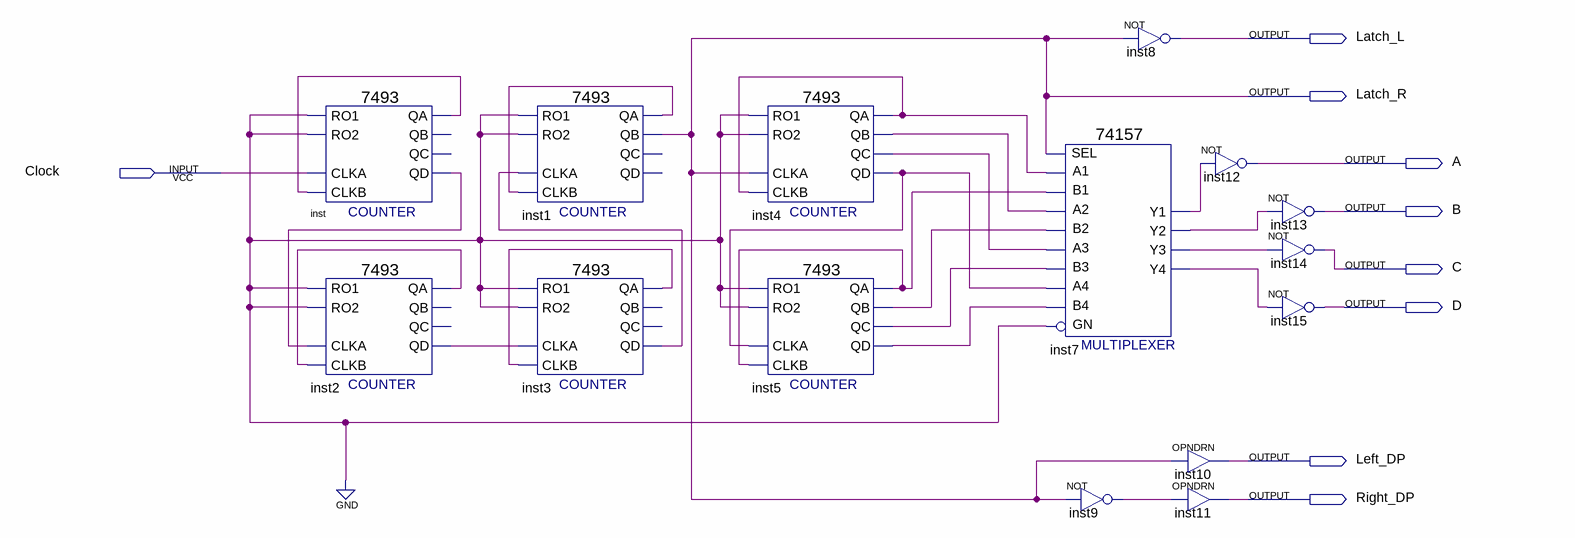
[diagram p0: schematic sheet]
// Quartus schematic test3.bdf as structural Verilog: 15 symbols, 9 pins
module test3 (
  input  Clock,
  output Latch_L,
  output Latch_R,
  output A,
  output B,
  output C,
  output D,
  output Left_DP,
  output Right_DP
);

  wire inst1_qa, inst2_qa, inst2_qd, inst3_qa, inst3_qd, inst4_qa, inst4_qb, inst4_qc, inst4_qd, inst5_qa,
       inst5_qb, inst5_qc, inst5_qd, inst7_y1, inst7_y2, inst7_y3, inst7_y4, inst9_out, inst_qa, inst_qd;

  \7493  inst (.RO1(1'b0), .RO2(1'b0), .CLKA(Clock), .CLKB(inst_qa), .QA(inst_qa), .QD(inst_qd));  // open: QC, QB
  \7493  inst2 (.RO1(1'b0), .RO2(1'b0), .CLKA(inst_qd), .CLKB(inst2_qa), .QA(inst2_qa), .QD(inst2_qd));  // open: QC, QB
  \7493  inst1 (.RO1(1'b0), .RO2(1'b0), .CLKA(inst3_qd), .CLKB(inst1_qa), .QB(Latch_R), .QA(inst1_qa));  // open: QC, QD
  \7493  inst3 (
    .RO1(1'b0), .RO2(1'b0), .CLKA(inst2_qd), .CLKB(inst3_qa), .QA(inst3_qa), .QD(inst3_qd));  // open: QC, QB
  \7493  inst4 (
    .RO1(1'b0), .RO2(1'b0), .CLKA(Latch_R), .CLKB(inst4_qa), .QC(inst4_qc), .QB(inst4_qb), .QA(inst4_qa),
    .QD(inst4_qd));
  \7493  inst5 (
    .RO1(1'b0), .RO2(1'b0), .CLKA(inst4_qd), .CLKB(inst5_qa), .QC(inst5_qc), .QB(inst5_qb), .QA(inst5_qa),
    .QD(inst5_qd));
  \74157  inst7 (
    .A1(inst4_qa), .B1(inst5_qa), .SEL(Latch_R), .B2(inst5_qb), .A3(inst4_qc), .B3(inst5_qc), .A2(inst4_qb),
    .B4(inst5_qd), .GN(1'b0), .A4(inst4_qd), .Y2(inst7_y2), .Y1(inst7_y1), .Y4(inst7_y4), .Y3(inst7_y3));
  not inst8 (Latch_L, Latch_R);
  not inst9 (inst9_out, Latch_R);
  not inst12 (A, inst7_y1);
  OPNDRN inst10 (.IN(Latch_R), .OUT(Left_DP));
  OPNDRN inst11 (.IN(inst9_out), .OUT(Right_DP));
  not inst13 (B, inst7_y2);
  not inst14 (C, inst7_y3);
  not inst15 (D, inst7_y4);
endmodule
